# EAGLE design interface_aprs (EAGLE 7.6.0)
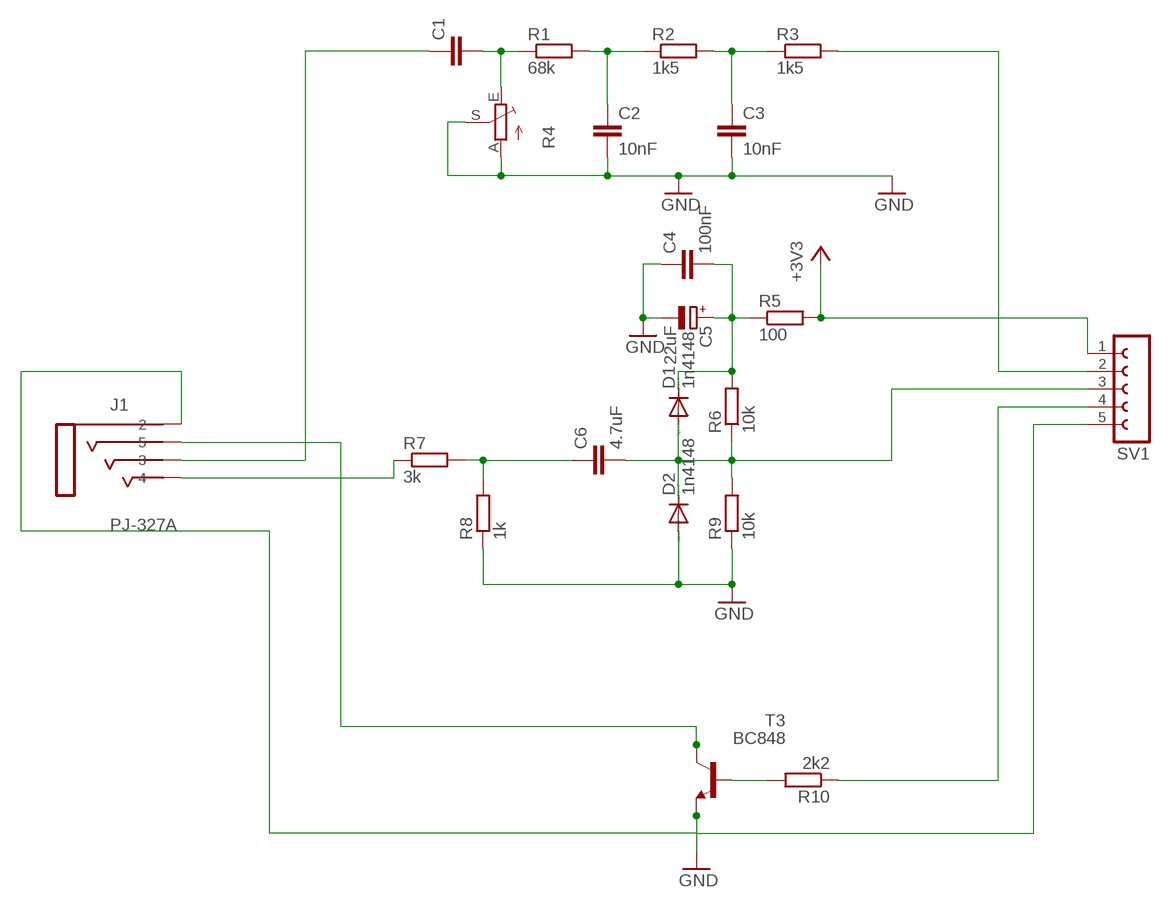
[diagram p0: schematic, sheet 1]

## Parts
C1  C-EUC0805  [C0805]
C2  10nF  C-EUC0805  [C0805]
C3  10nF  C-EUC0805  [C0805]
C4  100nF  C-EUC0805  [C0805]
C5  22uF  CPOL-EUB/3528-21R  [B/3528-21R]
C6  4.7uF  C-EUC0805  [C0805]
D1  1n4148  DIODE-DO214AA  [DO214AA]
D2  1n4148  DIODE-DO214AA  [DO214AA]
J1  PJ-327A  [PJ-327A_SMD]
R1  68k  R-EU_R0805  [R0805]
R2  1k5  R-EU_R0805  [R0805]
R3  1k5  R-EU_R0805  [R0805]
R4  TRIM_EU-B25P  [B25P]
R5  100  R-EU_R0805  [R0805]
R6  10k  R-EU_R0805  [R0805]
R7  3k  R-EU_R0805  [R0805]
R8  1k  R-EU_R0805  [R0805]
R9  10k  R-EU_R0805  [R0805]
R10  2k2  R-EU_R0805  [R0805]
SV1  FE05-1  [FE05-1]
T3  BC848  BC848A-NPN-SOT23-BEC  [SOT23-BEC]

## Nets
+3V3: R5.2 SV1.1
GND: C2.2 C3.2 C4.1 C5.- D2.A J1.2 R4.A R4.S R8.1 R9.1 SV1.5 T3.E
N$1: C2.1 R1.2 R2.1
N$2: C3.1 R2.2 R3.1
N$3: C1.2 R1.1 R4.E
N$4: C1.1 J1.3
N$5: R10.2 T3.B
N$6: C6.1 R7.2 R8.2
N$7: C4.2 C5.+ D1.C R5.1 R6.2
N$8: C6.2 D1.A D2.C R6.1 R9.2 SV1.3
N$9: J1.5 T3.C
N$11: R10.1 SV1.4
N$13: R3.2 SV1.2
N$15: J1.4 R7.1

## Library data of the parts
C1-C4 C6 = rcl:C-EU: CAPACITOR, European symbol
C5 = rcl:CPOL-EU: POLARIZED CAPACITOR, European symbol
D1 D2 = diode:DIODE-: DIODE
J1 = PJ-327A_SMD:PJ-327A: PJ-327A 3.5mm Stereo Audio Jack SMD Conector Jack 3.5mm hembra estereo SMD de 4 contactos (pines 2, 3, 4, 5). Diseñado segun especificaciones del plano mecanico: Cuerpo: 12.1 mm x 6.1 mm x 5.0 mm Pads SMD: 1.4 mm x 2.5 mm en Y=+3.25 (Pines 2, 3, 4) y Y=-3.25 (Pin 5) Pines en X: Pin 2 (3.2 mm), Pin 3 (6.2 mm), Pin 4 (10.2 mm), Pin 5 (11.3 mm) 2 Agujeros guia: Diametro 1.5 mm en X=1.6 mm y X=8.6 mm (distancia 7.0 mm) Rating: 0.3A 30V DC
R1-R3 R5-R10 = rcl:R-EU_: RESISTOR, European symbol
R4 = pot:TRIM_EU-: POTENTIOMETER
SV1 = con-lsta:FE05-1: FEMALE HEADER; OC_FARNELL: unknown; OC_NEWARK: unknown
T3 = transistor:*-NPN-: NPN Transistror BF959 corrected 2008.03.06

## Board
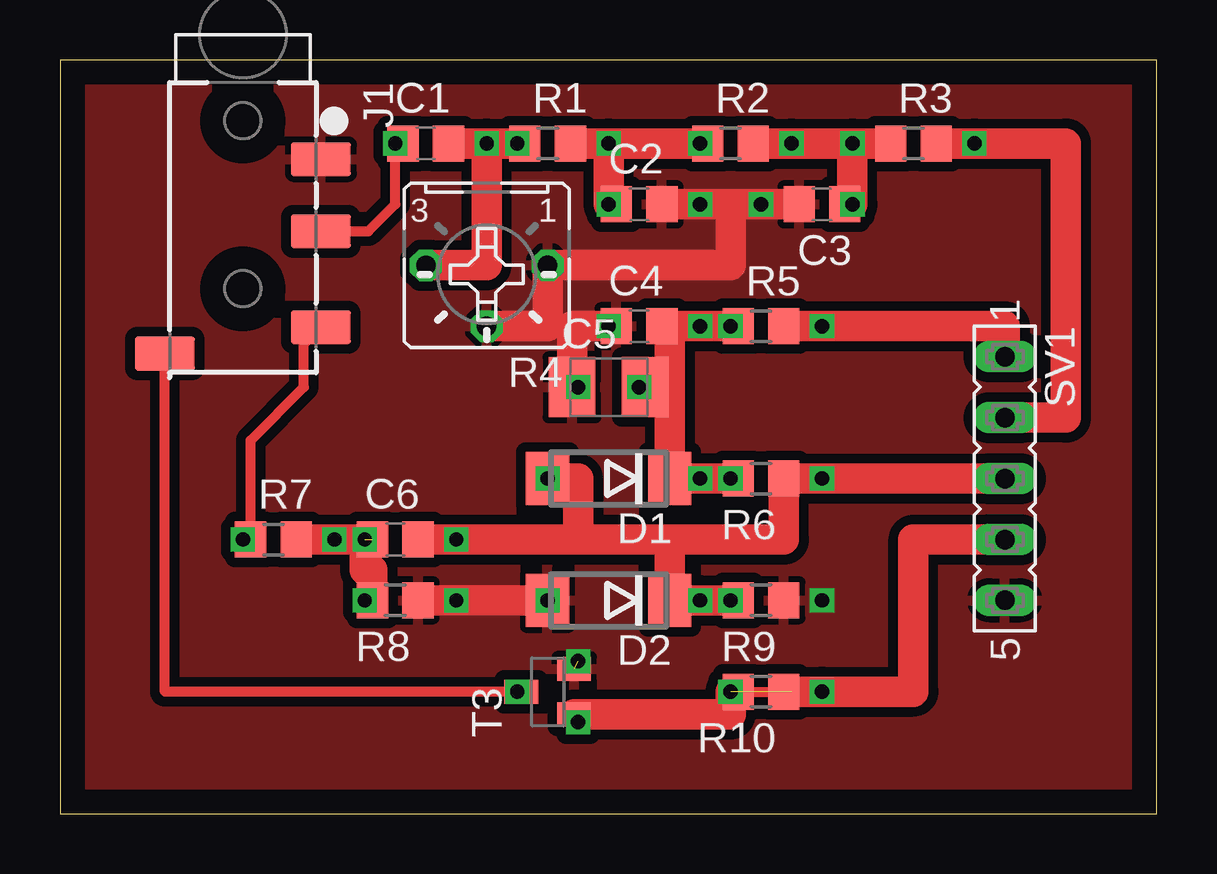
[diagram p1: board, top side]

Size 45.7 x 31.42 mm. Coordinates in mm from the lower left corner, seen from the top.
Outline: 0,0 45.7,0 45.7,31.42 0,31.42 0,0
Copper layers (1*16): Top 0.035mm / dielectric 1.5mm / Bottom 0.035mm
Design rules "default": minimum track width 10mil, minimum drill 24mil, track to track 8mil, track to pad 8mil, pad to pad 8mil, via to via 8mil, smd to smd 8mil, copper to edge 40mil, drill to drill 8mil, minimum pad ring 10mil, minimum via ring 8mil, stop-mask expansion 4mil, vias tented up to drill 0mil, thermal gap 10mil

### Footprints (pad centres in the part's own frame; a part is rotated, then mirrored left to right if it is on the bottom)
C0805 = smd 1.3 x 1.5: 1 -0.95,0; 2 0.95,0
B/3528-21R = smd 1.95 x 2.5: + 1.525,0; - -1.525,0
DO214AA = smd 1.8 x 2.2: A 2.55,0; C -2.55,0
PJ-327A_SMD = smd 1.4 x 2.5: 2 3.2,3.25; 3 6.2,3.25; 4 10.2,3.25; 5 11.3,-3.25 | hole 1.5: 1.6,0; 8.6,0
R0805 = smd 1.3 x 1.5: 1 -0.95,0; 2 0.95,0
B25P = drill 0.813 octagon: A -2.54,0; E 2.54,0; S 0,2.54
FE05-1 = drill 0.813 long: 1 -5.08,0; 2 -2.54,0; 3 0,0; 4 2.54,0; 5 5.08,0
SOT23-BEC = smd 1 x 1.4: B -0.95,-1.1; C 0,1.1; E 0.95,-1.1

### Placement (x,y rotation side)
C1  15.24,27.94 0 top
C2  24.13,25.4 0 top
C3  31.75,25.4 180 top
C4  24.13,20.32 0 top
C5  22.86,17.78 0 top
C6  13.97,11.43 0 top
D1  22.86,13.97 180 top
D2  22.86,8.89 180 top
J1  7.62,30.48 270 top
R1  20.32,27.94 0 top
R2  27.94,27.94 0 top
R3  35.56,27.94 0 top
R4  17.78,22.86 180 top
R5  29.21,20.32 0 top
R6  29.21,13.97 180 top
R7  8.89,11.43 0 top
R8  13.97,8.89 180 top
R9  29.21,8.89 180 top
R10  29.21,5.08 180 top
SV1  39.37,13.97 270 top
T3  20.32,5.08 90 top

### Tracks (layer width: path | path; a pad name or v marks a point on that pad's centre or on a via)
+3V3  (via drill 0.6)
  Top 1.27: R5.2 v31.75,20.32 39.37,20.32 SV1.1
GND  (via drill 0.6)  (1 unrouted)
  Top 1.27: C2.2 v26.67,25.4 27.94,25.4 | 27.94,25.4 v29.21,25.4 30.48,25.4 | 27.94,25.4 27.94,22.86 R4.A 20.32,20.32 R4.S | C4.1 v22.86,20.32 21.34,20.32 C5.- | R8.1 v16.51,8.89 D2.A
  other vias: 21.59,6.35 20.32,8.89 31.75,8.89
  pour Top (isolate 0.406): -2.54,101.6 165.1,101.6 165.1,-12.7 -2.54,-12.7
N$1  (via drill 0.6)
  Top 1.27: C2.1 v22.86,25.4 v22.86,27.94 | R1.2 v22.86,27.94 | v22.86,27.94 v26.67,27.94 R2.1
N$2  (via drill 0.6)
  Top 1.27: C3.1 v33.02,25.4 v33.02,27.94 | R2.2 v30.48,27.94 v33.02,27.94 | v33.02,27.94 R3.1
N$3  (via drill 0.6)
  Top 1.27: C1.2 v17.78,27.94 | v17.78,27.94 v19.05,27.94 R1.1 | R4.E 17.78,22.86 v17.78,27.94
N$4
  Top 0.406: J1.3 12.85,24.28 13.97,25.4 13.97,27.62 C1.1
N$5  (via drill 0.6)  (1 unrouted)
  Top 0.406: R10.2 30.48,5.08
  Top 1.27: T3.B 27.94,4.13 v27.94,5.08
N$6  (via drill 0.6)  (1 unrouted)
  Top 1.27: R7.2 v11.43,11.43 v12.7,11.43 12.7,10.16 13.02,10.16 R8.2
N$7  (via drill 0.6)
  Top 1.27: R6.2 v27.94,13.97 v26.67,13.97 D1.C 25.41,17.78 | R5.1 v27.94,20.32 v26.67,20.32 C4.2 25.41,20.32 25.41,17.78 | C5.+ 25.41,17.78
N$8  (via drill 0.6)
  Top 1.27: D1.A v20.32,13.97 21.59,13.97 21.59,11.43 | 21.59,11.43 25.41,11.43 | 25.41,11.43 D2.C v26.67,8.89 v27.94,8.89 R9.2 | C6.2 v16.51,11.43 21.59,11.43 | 25.41,11.43 30.16,11.43 R6.1 v31.75,13.97 SV1.3
N$9
  Top 0.406: T3.C 4.37,5.08 J1.5
N$10  (via drill 0.6)
  other vias: 12.7,8.89
N$11  (via drill 0.6)
  Top 1.27: R10.1 v31.75,5.08 35.56,5.08 35.56,11.43 SV1.4
N$13  (via drill 0.6)
  Top 1.27: R3.2 v38.1,27.94 41.91,27.94 41.91,16.51 SV1.2
N$14  (via drill 0.6)
  other vias: 7.62,11.43
N$15
  Top 0.406: R7.1 7.94,15.56 10.16,17.78 10.16,19.57 J1.4
N$16  (via drill 0.6)
  other vias: 21.59,3.81
N$17  (via drill 0.6)
  other vias: 19.05,5.08
N$20  (via drill 0.6)
  other vias: 21.59,17.78
N$21  (via drill 0.6)
  other vias: 24.13,17.78
N$22  (via drill 0.6)
  other vias: 13.97,27.94

### Text on the board
tValues: 3v3 | TX | RX | PTT | GND